# Altium project ublox_gnss_node.PrjPcb (part 3 of 3)

## Sheet Memory.SchDoc: Ublox GNSS Node
size A4; DocumentNumber: 10; SheetNumber: 10; SheetTotal: 12
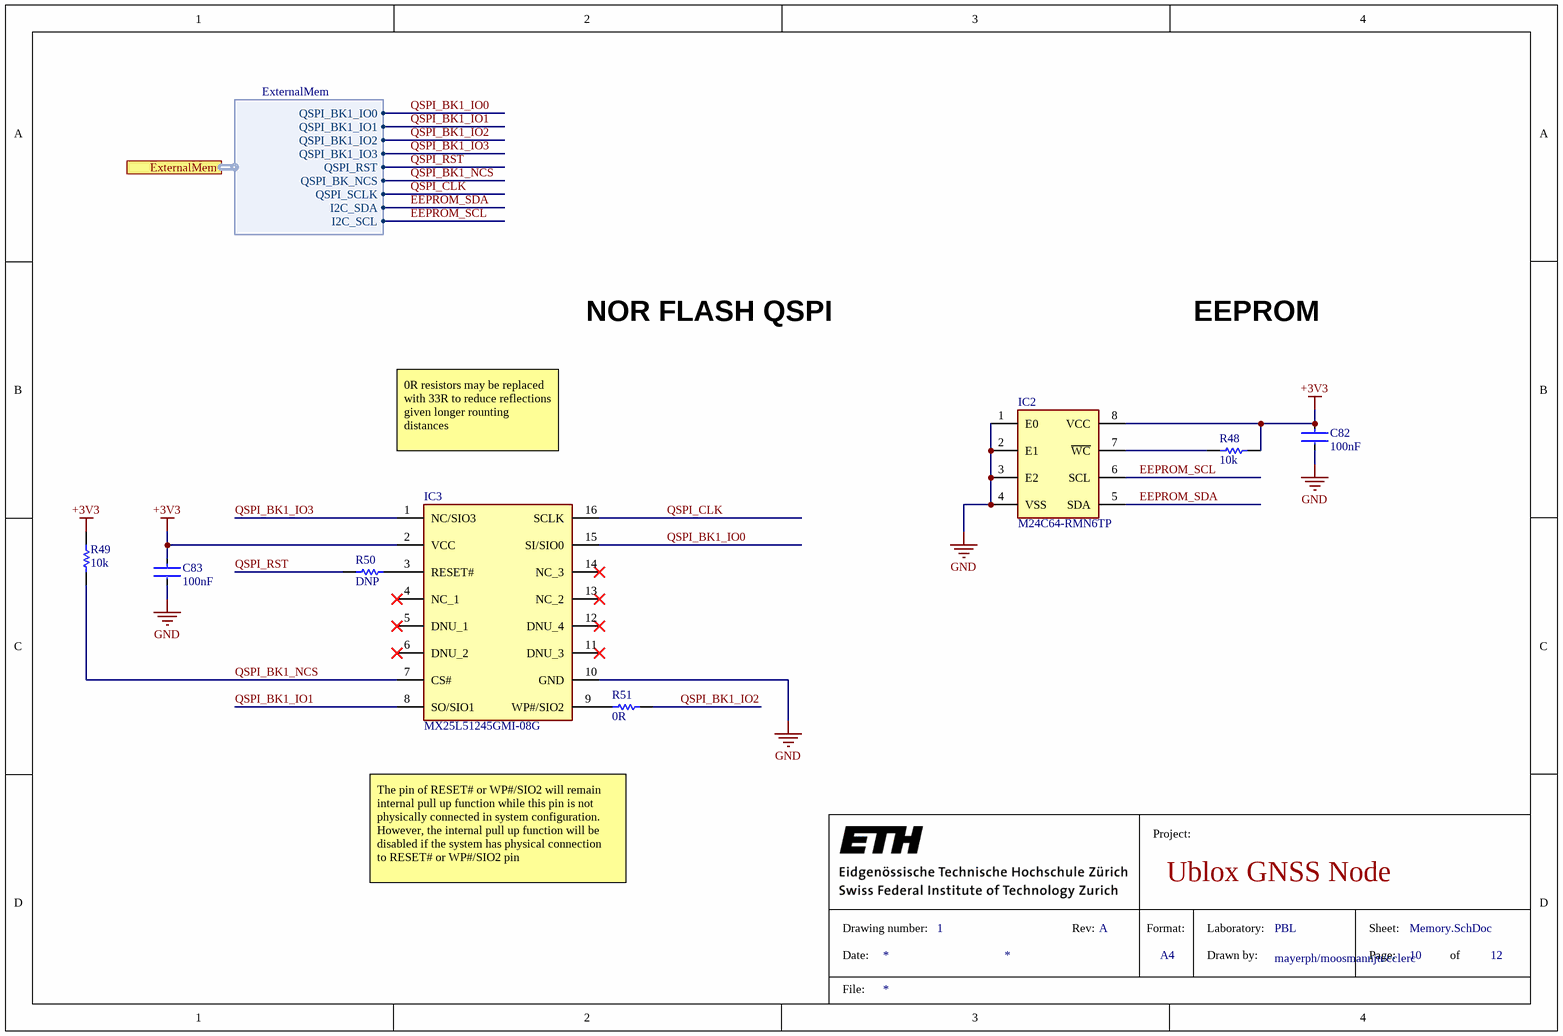
[diagram p9: Memory.SchDoc]

### Parts
C82  100nF  [FP-C0603C-CF-MFG]
C83  100nF  [FP-C0603C-CF-MFG]
IC2  M24C64-RMN6TP  [SOIC127P600X175-8N]
IC3  MX25L51245GMI-08G  [SOIC127P1030X265-16N]
R48  10k  [RESC1005X40X25ML05T05]
R49  10k  [RESC1005X40X25ML05T05]
R50  DNP  [RESC1005X40X25LL05T10]
R51  0R  [RESC1005X40X25LL05T10]

### Ports
ExternalMem (harness ExternalMem, see MAIN[6A], MCU[1C])

### Harnesses
ExternalMem: QSPI_BK1_IO0, QSPI_BK1_IO1, QSPI_BK1_IO2, QSPI_BK1_IO3, QSPI_RST, QSPI_BK_NCS, QSPI_SCLK, I2C_SDA, I2C_SCL

### Nets
+3V3: C82.1 C83.1 IC2.8(VCC) IC3.2(VCC) R48.2 R49.2
GND: C82.2 C83.2 IC2.1(E0) IC2.2(E1) IC2.3(E2) IC2.4(VSS) IC3.10(GND)
EEPROM_SCL: IC2.6(SCL) ; port ExternalMem.I2C_SCL
EEPROM_SDA: IC2.5(SDA) ; port ExternalMem.I2C_SDA
QSPI_BK1_IO0: IC3.15(SI/SIO0) ; port ExternalMem.QSPI_BK1_IO0
QSPI_BK1_IO1: IC3.8(SO/SIO1) ; port ExternalMem.QSPI_BK1_IO1
QSPI_BK1_IO2: R51.2 ; port ExternalMem.QSPI_BK1_IO2
QSPI_BK1_IO3: IC3.1(NC/SIO3) ; port ExternalMem.QSPI_BK1_IO3
QSPI_BK1_NCS: IC3.7(CS#) R49.1 ; port ExternalMem.QSPI_BK_NCS
QSPI_CLK: IC3.16(SCLK) ; port ExternalMem.QSPI_SCLK
QSPI_RST: R50.1 ; port ExternalMem.QSPI_RST
NetIC2_7: IC2.7(~{WC}) R48.1
NetIC3_3: IC3.3(RESET#) R50.2
NetIC3_9: IC3.9(WP#/SIO2) R51.1

Not connected (* = marked no-connect by the designer): IC3 4(NC_1)* 5(DNU_1)* 6(DNU_2)* 11(DNU_3)* 12(DNU_4)* 13(NC_2)* 14(NC_3)*

### Notes on the sheet
- NOR FLASH QSPI
- EEPROM
- 0R resistors may be replaced with 33R to reduce reflections given longer rounting distances
- The pin of RESET# or WP#/SIO2 will remain
  internal pull up function while this pin is not
  physically connected in system configuration.
  However, the internal pull up function will be
  disabled if the system has physical connection
  to RESET# or WP#/SIO2 pin
- Project:
- Drawing number:
- Date:
- 1
- Rev:
- Format:
- A4
- Laboratory:
- Drawn by:
- Sheet:
- Page:
- of
- File:

### Library data of the parts
C82 C83 = CMP-2006-03061-2: Capacitor 100nF 0603; Manufacturer: KEMET; Manufacturer Part Number: C0603C104K5RACTU; Tolerance: 0.1; Temperature Coefficient: 30ppm/°C; Material: Ceramic; Automotive Grade: Grade 1; Voltage Rating: 50 V; Value: 0.10 μF; Temperature Characteristic: X7R; Temperature: -55°C to +125°C; RoHS: TRUE; Temperature Range High: +125°C; Lead Free: Yes; Octopart: https://octopart.com/c0603c104k5ractu-kemet-139244; Digikey Description: CAP CER 0.1UF 50V X7R 0603; Category: Cap; Package: C0603C-CF; ComponentLink2Description: Datasheet; Temperature Range Low: -55°C; Device Class L1: Passive Components; Automotive: Yes; Device Class L3: Ceramic Capacitors; ComponentLink2URL: https://api.kemet.com/component-edge/download/datasheet/C0603C100J5GACAUTO.pdf; Capacitance: 0.10 μF; Device Class L2: Capacitors; Height: 0.87mm; Supplier 1: Mouser; Supplier Part Number 1: 80-C0603C104K5R7867
IC2 = M24C64-FMN6TP: EEPROM ST 64kbit I2C; Manufacturer_Name: STMicroelectronics; Datasheet Link: https://www.st.com/resource/en/datasheet/m24c64-f.pdf; Height: 1.75mm; Mouser Part Number: 511-M24C64-RMN6TP; Mouser Price/Stock: https://www.mouser.co.uk/ProductDetail/STMicroelectronics/M24C64-FMN6TP?qs=bKyP%252BnDORLFSmkTpM6wmYg%3D%3D; Arrow Part Number: M24C64-RMN6TP; Arrow Price/Stock: https://www.arrow.com/en/products/m24c64-fmn6tp/stmicroelectronics?utm_currency=USD&region=europe; Manufacturer Part Number: M24C64-RMN6TP
IC3 = MX25L51245GMI-08G: NOR Flahs 512MBit QSPI Macronix; Datasheet Link: https://datasheet.datasheetarchive.com/originals/dk/DKDS-14/274585.pdf; Height: 2.65mm; Manufacturer_Name: Macronix; Manufacturer Part Number: MX25L51245GMI-08G; Arrow Part Number: MX25L51245GMI-08G; Arrow Price/Stock: https://www.arrow.com/en/products/mx25l51245gmi-08g/macronix-international?region=nac
R48 R49 = CMP-2002-00433-1: Resistor 10k 0402; Manufacturer Part Number: ERJ-2GEJ103X; Manufacturer: Panasonic; Supplier 1: Mouser; Supplier Part Number 1: 667-ERJ-2GEJ103X
R50 R51 = CMP-2002-03041-1: Resistor 0R 0402; Part Number: CRCW04020000Z0EDHP; Manufacturer: Vishay Dale; Value: 0Ohm; Voltage Rating: 50V; Power Rating: 200mW; Temperature Coefficient: 0ppm/°C; Max Power Dissipation: 125mW; Supplier 1: Digi-Key; Supplier Part Number 1: 541-0.0YBCT-ND; Manufacturer Part Number: CRCW04020000Z0EDHP; RoHS: Yes; Category: Chip SMD Resistors; Stock 1: 527407; Pricing 1: 1=0.13000, 10=0.11300, 25=0.07840, 50=0.06080, 100=0.04350, 250=0.03388, 500=0.02694, 1000=0.01912, 5000=0.01477 (USD); Mount: Surface Mount; Case/Package: 0402; Weight: 2.3E-05oz; Case Code (Metric): 1005; Case Code (Imperial): 0402; Contact Plating: Tin; Min Operating Temperature: -55°C; Max Operating Temperature: 155°C; Packaging: Tape and Reel; Composition: Thick Film; Termination: SMD/SMT; Voltage Rating (DC): 50V; Package Quantity: 1; Military Standard: Not; Number of Terminations: 2; Features: Automotive AEC-Q200; Length: 1mm; Height: 0.3mm; Width: 0.02inch; Depth: 0.5mm; Radiation Hardening: No; REACH SVHC: Unknown; Lead Free: Lead Free; ComponentLink1URL: https://datasheet.ciiva.com/16494/crcwhpe3-16494453.pdf?src-supplier=Future+Electronics; ComponentLink1Description: https://datasheet.ciiva.com/16494/crcwhpe3-16494453.pdf?src-supplier=Future+Electronics; ComponentLink2URL: https://datasheet.ciiva.com/2470/crcwhpe3-2470555.pdf?src-supplier=Digi-Key; ComponentLink2Description: https://datasheet.ciiva.com/2470/crcwhpe3-2470555.pdf?src-supplier=Digi-Key; ComponentLink3URL: https://datasheet.ciiva.com/5562/crcwhpe3-46056-5562315.pdf?src-supplier=Mouser; ComponentLink3Description: https://datasheet.ciiva.com/5562/crcwhpe3-46056-5562315.pdf?src-supplier=Mouser; ComponentLink4URL: https://datasheet.ciiva.com/9109/crcwhpe3-9109963.pdf?src-supplier=Avnet; ComponentLink4Description: https://datasheet.ciiva.com/9109/crcwhpe3-9109963.pdf?src-supplier=Avnet; ComponentLink5URL: https://datasheet.ciiva.com/2470/crcwhpe3-2470556.pdf?src-supplier=Digi-Key; ComponentLink5Description: https://datasheet.ciiva.com/2470/crcwhpe3-2470556.pdf?src-supplier=Digi-Key; ComponentLink6URL: https://datasheet.ciiva.com/28621/1912814-28621324.pdf?src-supplier=Element14; ComponentLink6Description: https://datasheet.ciiva.com/28621/1912814-28621324.pdf?src-supplier=Element14; ComponentLink7URL: https://datasheet.ciiva.com/2470/crcwhpe3-2470557.pdf?src-supplier=Digi-Key; ComponentLink7Description: https://datasheet.ciiva.com/2470/crcwhpe3-2470557.pdf?src-supplier=Digi-Key; ComponentLink8URL: https://datasheet.ciiva.com/7725/crcwhpe3-7725758.pdf?src-supplier=Element14; ComponentLink8Description: https://datasheet.ciiva.com/7725/crcwhpe3-7725758.pdf?src-supplier=Element14

## Sheet Mikro_Bus.SchDoc: Ublox GNSS Node
size A4; DocumentNumber: 11; SheetNumber: 11; SheetTotal: 12
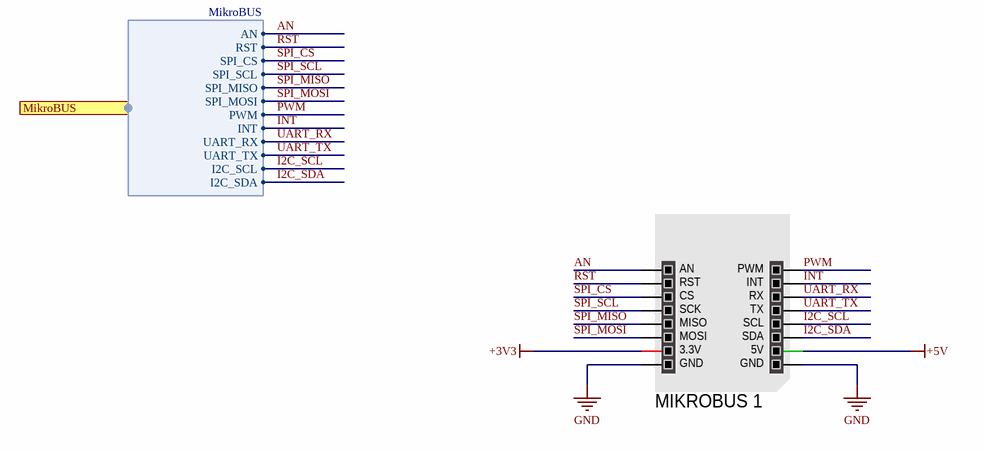
[diagram p10: Mikro_Bus.SchDoc]

### Parts
MIKROBUS_1  MIKROBUS HOST CONN.  [MIKROBUS HOST CONN. SMD]  (value not drawn)

### Ports
MikroBUS (harness MikroBUS, see MAIN[3A], MCU[1C])

### Harnesses
MikroBUS: AN, RST, SPI_CS, SPI_SCL, SPI_MISO, SPI_MOSI, PWM, INT, UART_RX, UART_TX, I2C_SCL, I2C_SDA

### Nets
+3V3: MIKROBUS_1.7(3.3V)
+5V: MIKROBUS_1.10(5V)
GND: MIKROBUS_1.8(GND) MIKROBUS_1.9(GND)
AN: MIKROBUS_1.1(AN) ; port MikroBUS.AN  [project net ADC]
I2C_SCL: MIKROBUS_1.12(SCL) ; port MikroBUS.I2C_SCL
I2C_SDA: MIKROBUS_1.11(SDA) ; port MikroBUS.I2C_SDA
INT: MIKROBUS_1.15(INT) ; port MikroBUS.INT
PWM: MIKROBUS_1.16(PWM) ; port MikroBUS.PWM  [project net MB_PWM]
RST: MIKROBUS_1.2(RST) ; port MikroBUS.RST  [project net MB_RST]
SPI_CS: MIKROBUS_1.3(CS) ; port MikroBUS.SPI_CS
SPI_MISO: MIKROBUS_1.5(MISO) ; port MikroBUS.SPI_MISO  [project net SPI3_MISO]
SPI_MOSI: MIKROBUS_1.6(MOSI) ; port MikroBUS.SPI_MOSI  [project net SPI3_MOSI]
SPI_SCL: MIKROBUS_1.4(SCK) ; port MikroBUS.SPI_SCL  [project net SPI3_SCLK]
UART_RX: MIKROBUS_1.14(RX) ; port MikroBUS.UART_RX  [project net UART5_RX]
UART_TX: MIKROBUS_1.13(TX) ; port MikroBUS.UART_TX  [project net UART5_TX]

### Notes on the sheet
- Project:
- Drawing number:
- Date:
- 1
- Rev:
- Format:
- A4
- Laboratory:
- Drawn by:
- Sheet:
- Page:
- of
- File:

### Library data of the parts
MIKROBUS_1 = MIKROBUS HOST CONN._1: mikroBUS Host Socket; SMD: No; Supplier: DigiKey; Supplier Part Number: 1471-MIKROE-5210-ND

## Sheet POE_PMUX.SchDoc: Ublox GNSS Node
size A4; DocumentNumber: 12; SheetNumber: 12; SheetTotal: 12
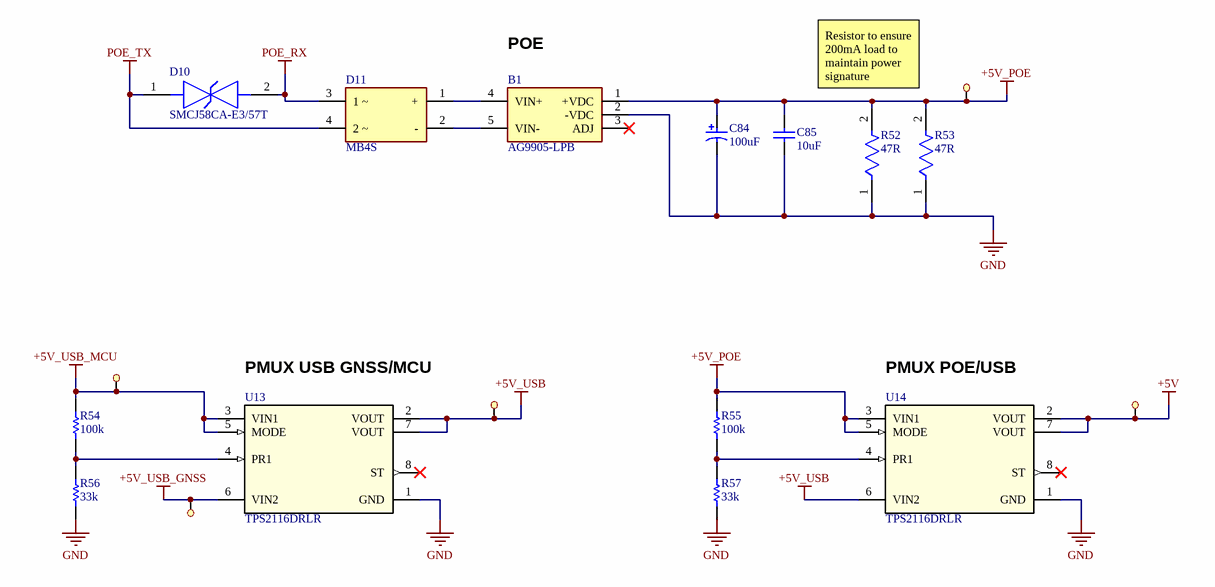
[diagram p11: POE_PMUX.SchDoc]

### Parts
*25  testpoint  [testpoint]  (value not drawn)
*26  testpoint  [testpoint]  (value not drawn)
*27  testpoint  [testpoint]  (value not drawn)
*28  testpoint  [testpoint]  (value not drawn)
*29  testpoint  [testpoint]  (value not drawn)
B1  AG9905-LPB  [AG9905MTB]
C84  100uF  [NIC-CAPA2-6.3X7.7_V]
C85  10uF  [FP-GRM188-0_2-IPC_C]
D10  SMCJ58CA-E3/57T  [FP-95402-MFG]
D11  MB4S  [FP-751EP-MFG]
R52  47R  [FP-RMCF2512-MFG]
R53  47R  [FP-RMCF2512-MFG]
R54  100k  [RESC0603(1608)_N]
R55  100k  [RESC0603(1608)_N]
R56  33k  [RESC3116X65X40LL10T20]
R57  33k  [RESC3116X65X40LL10T20]
U13  TPS2116DRLR  [DRL0008A-MFG]
U14  TPS2116DRLR  [DRL0008A-MFG]

### Nets
+5V: *28.1 U14.2(VOUT) U14.7(VOUT)
+5V_POE: *25.1 B1.1(+VDC) C84.1 C85.2 R52.2 R53.2 R55.1 U14.3(VIN1) U14.5(MODE)
+5V_USB: *27.1 U13.2(VOUT) U13.7(VOUT) U14.6(VIN2)
+5V_USB_GNSS: *29.1 U13.6(VIN2)
+5V_USB_MCU: *26.1 R54.1 U13.3(VIN1) U13.5(MODE)
GND: B1.2(-VDC) C84.2 C85.1 R52.1 R53.1 R56.2 R57.2 U13.1(GND) U14.1(GND)
POE_RX: D10.2 D11.3(1_~)
POE_TX: D10.1 D11.4(2_~)
NetB1_4: B1.4(VIN+) D11.1(+)
NetB1_5: B1.5(VIN-) D11.2(-)
NetR54_2: R54.2 R56.1 U13.4(PR1)
NetR55_2: R55.2 R57.1 U14.4(PR1)

Not connected (* = marked no-connect by the designer): B1 3(ADJ)*; U13 8(ST)*; U14 8(ST)*

### Notes on the sheet
- (near B1) POE
- Resistor to ensure 200mA load to maintain power signature
- (near U13) PMUX USB GNSS/MCU
- (near U14) PMUX POE/USB
- Project:
- Drawing number:
- Date:
- 1
- Rev:
- Format:
- A4
- Laboratory:
- Drawn by:
- Sheet:
- Page:
- of
- File:

### Library data of the parts
B1 = AG9905-MTB: Power over Ethernet - PoE PD Module, Isolated DC-DC converter, IEEE802.3af compliant, Over Temp. Protection, Ind Temp. Range, Small Footprint, SMT. (Blocks not pins).; Manufacturer Name: Silvertel; Geometry.Height: 13.05mm; Manufacturer Part Number: AG9905-LPB; Mouser Part Number: 480-AG9905-LPB; Mouser Price/Stock: https://www.mouser.co.uk/ProductDetail/Silvertel/AG9905-MTB?qs=vvQtp7zwQdPQM58WrfW9tQ%3D%3D; Arrow Part Number: *; Arrow Price/Stock: *; Datasheet Link: https://www.silvertel.com/images/datasheets/Ag9900M-datasheet-ultra-miniature-isolated-Power-over-Ethernet-POE-module.pdf
C84 = CMP-0687-00063-1: Aluminum Electrolytic Capacitor, UD Series, Low Impedance, 100 uF, 25 V, + / - 20%, -55 to 105 degC, Chip Type, 6.3 x 7.7 mm D x L, Pb-Free, Reel; PartNumber: UUD1E101MCL1GS; Manufacturer: Nichicon; Rated Ripple Current (at 100kHz): 280 mA; Endurance Time: 2000 h; Rated Voltage: 25 V; Packing: Dia382mm Reel; Tolerance Rated Capacitance: -20 to 20%; Impedance: 0.34 Ohm; PackageReference: CAPAE-D6.3H7.7; RoHS: TRUE; PackageDescription: 2-Pin Surface Mount Device, Diameter 6.3 mm, Height 7.7 mm, Pitch 5.4 mm; Mounting Technology: Surface Mount; ComponentLink3Description: Package Specification; Diameter: 6.3 mm; DatasheetVersion: 08/2012; ComponentLink3URL: http://products.nichicon.co.jp/en/pdf/XJA043/e-ud.pdf; Length: 7.7 mm; ComponentLink2Description: Datasheet; ComponentLink2URL: http://products.nichicon.co.jp/en/pdf/XJA043/e-ud.pdf; Rated Capacitance: 100 uF; ComponentLink1Description: Manufacturer URL; ComponentLink1URL: http://www.nichicon.co.jp/
C85 = GRM188R61E106MA73D: CAP CER 10UF 25V X5R 0603; Manufacturer: Murata; Tolerance: 20%; Supplier: Digi-Key; Supplier Part Number: 490-7202-6-ND; Manufacturer Part Number: GRM188R61E106MA73D; RoHS: Yes; Category: Ceramic Capacitors; Stock: 3353344; Pricing: 1=0.26, 10=0.176, 50=0.1176, 100=0.0999, 500=0.07054, 1000=0.06173 (USD); ComponentLink1URL: https://datasheet.ciiva.com/14906/partnumbering-e-01-14906429.pdf?src-supplier=Digi-Key; ComponentLink1Description: https://datasheet.ciiva.com/14906/partnumbering-e-01-14906429.pdf?src-supplier=Digi-Key; ComponentLink2URL: https://datasheet.ciiva.com/14906/partnumbering-e-01-14906431.pdf?src-supplier=Digi-Key; ComponentLink2Description: https://datasheet.ciiva.com/14906/partnumbering-e-01-14906431.pdf?src-supplier=Digi-Key; ComponentLink3URL: https://datasheet.ciiva.com/22776/608985-22776426.pdf?src-supplier=Farnell; ComponentLink3Description: https://datasheet.ciiva.com/22776/608985-22776426.pdf?src-supplier=Farnell; ComponentLink4URL: https://datasheet.ciiva.com/22776/c02e-22776427.pdf?src-supplier=Farnell; ComponentLink4Description: https://datasheet.ciiva.com/22776/c02e-22776427.pdf?src-supplier=Farnell; ComponentLink5URL: https://datasheet.ciiva.com/22619/c02e-22619674.pdf?src-supplier=Element14; ComponentLink5Description: https://datasheet.ciiva.com/22619/c02e-22619674.pdf?src-supplier=Element14; Value: 10uF
D10 = CMP-02577-000016-1: TVS DIODE 58V 93.6V DO214AB; Manufacturer: Vishay Semiconductor Diodes Division; Standoff Height: 0mm; Peak Pulse Power: 1500W; Direction: Bidirectional; Automotive Grade: NA; Peak Pulse Current: 16A; Max Junction Temp: +150°C; Breakdown Voltage: 64.4V; Number Of Channels: 1; Temperature Range Low: -55°C; Mouser Description: TVS Diodes - Transient Voltage Suppressors 1500W 58V Bidirect; ComponentLink2URL: https://www.vishay.com/docs/88394/smcj.pdf; Height: 2.62mm; Octopart: https://octopart.com/smcj58ca-e3%2F57t-vishay-39599086; Temperature: -55°C to +150°C; Clamping Voltage: 93.6V; Device Class L1: Circuit Protection; Category: Diode; Automotive: No; Manufacturer Part Number: SMCJ58CA-E3/57T; ComponentLink2Description: Datasheet; Lead Free: Yes; Package: 95402; Temperature Range High: +150°C; Device Class L2: TVS Diodes; Device Class L3: unset; RoHS: TRUE; Footprint Url: http://www.vishay.com/docs/95402/smc.pdf; Digikey Description: TVS DIODE 58V 93.6V DO214AB; Reverse Standoff Voltage: 58V
D11 = CMP-07163-000033-1: BRIDGE RECT 1P 400V 500MA 4SOIC; Manufacturer: ON Semiconductor; Value: 13pF; Forward Current: 0.5A; Standoff Height: 0.05mm; Max Junction Temp: +150°C; Peak Reverse Current: 5uA; Max Surge Forward Current: 35A; Category: Diode; ComponentLink2Description: Datasheet; Max Repetitive Reverse Voltage: 400V; Device Class L1: Discrete Semiconductors; Mouser Description: Bridge Rectifiers 0.5A Bridge; Capacitance: 13pF; Lead Free: Yes; Device Class L2: Diodes; Height: 2.9mm; Temperature: -55°C to +150°C; Reverse Voltage: 400V; Manufacturer Part Number: MB4S; RoHS: TRUE; Temperature Range High: +150°C; Automotive: No; Package: 751EP; Octopart: https://octopart.com/mb4s-on+semiconductor-84329762; Temperature Range Low: -55°C; Ipc Land Pattern Name: SOIC254P670X265-4; Digikey Description: BRIDGE RECT 1P 400V 500MA 4SOIC; ComponentLink2URL: https://www.onsemi.com/pub/Collateral/MB8S-D.PDF; Device Class L3: Rectifier Diodes
R52 R53 = CMP-26527-006410-1: 47Ω ±5% 1W 2512 Thick Film Chip Resistor AEC-Q200 compliant; Manufacturer: Stackpole Electronics; Manufacturer Part Number: RMCF2512JT47R0; Temperature Coefficient: 200ppm/°C; Voltage Rating: 200V; Case Code (Metric): 6432; Tolerance: 5%; Power Rating: 1W; Number of Terminations: 2; Packaging: Tape and Reel; Min Operating Temperature: -55°C; Case Code (Imperial): 2512; Depth: 3.2mm; RoHS Compliant: Yes; Case/Package: 2512; Max Power Dissipation: 1W; Resistor Type: Thick Film; Military Standard: Not; Series: RMCF; Mount: Surface Mount; Features: Automotive AEC-Q200; Resistance: 47R; Contact Plating: Tin; Width: 0.126inch; Height: 0.028inch; Lead Free: Lead Free; Max Operating Temperature: 155°C; Length: 0.248inch; Construction: Rectangular; Radiation Hardening: No; Supplier: Avnet; Supplier Part Number: RMCF2512JT47R0; RoHS: Compliant; Category: Chip SMD Resistors; Stock: 96000; Pricing: 4000=0.03536, 8000=0.03484, 16000=0.03432, 32000=0.0338, 64000=0.03328 (USD); China RoHS: Non-Compliant; Composition: Thick Film; Country of Origin: Japan, Mainland China, Taiwan; Export Control Classification Number (ECCN) Code: EAR99; Harmonized Tariff Schedule (HTS) Code: 8533.21.00.30; Introduction Date: 2011-01-07; Lifecycle Status: Production; Mounting Technology: Surface Mount; Number of Terminals: 2; Ratings: AEC-Q200; REACH SVHC: Yes; Value: 47Ω; Schedule B: 8533210045, 8533210045|8533210045, 8533210045|8533210045|8533210045, 8533210045|8533210045|8533210045|8533210045; Working Voltage: 200V; ComponentLink1URL: https://datasheet.octopart.com:443/RMCF2512JT47R0-Stackpole-Electronics-datasheet-182148065.pdf?src-supplier=IHS; ComponentLink1Description: https://datasheet.octopart.com:443/RMCF2512JT47R0-Stackpole-Electronics-datasheet-182148065.pdf?src-supplier=IHS; ComponentLink2URL: https://datasheet.octopart.com:443/RMCF2512JT47R0-Stackpole-Electronics-datasheet-28504820.pdf?src-supplier=Upverter; ComponentLink2Description: https://datasheet.octopart.com:443/RMCF2512JT47R0-Stackpole-Electronics-datasheet-28504820.pdf?src-supplier=Upverter; ComponentLink3URL: https://datasheet.octopart.com:443/RMCF2512JT47R0-Stackpole-Electronics-datasheet-141193804.pdf?src-supplier=Master+Electronics; ComponentLink3Description: https://datasheet.octopart.com:443/RMCF2512JT47R0-Stackpole-Electronics-datasheet-141193804.pdf?src-supplier=Master+Electronics; ComponentLink4URL: https://datasheet.octopart.com:443/RMCF2512JT47R0-Stackpole-Electronics-datasheet-189104163.pdf?src-supplier=Master+Electronics; ComponentLink4Description: https://datasheet.octopart.com:443/RMCF2512JT47R0-Stackpole-Electronics-datasheet-189104163.pdf?src-supplier=Master+Electronics; ComponentLink5URL: https://datasheet.octopart.com:443/RMCF2512JT47R0-Stackpole-Electronics-datasheet-116606903.pdf?src-supplier=Master+Electronics; ComponentLink5Description: https://datasheet.octopart.com:443/RMCF2512JT47R0-Stackpole-Electronics-datasheet-116606903.pdf?src-supplier=Master+Electronics; ComponentLink6URL: https://datasheet.octopart.com:443/RMCF2512JT47R0-Stackpole-Electronics-datasheet-62091608.pdf?src-supplier=Stackpole+Electronics; ComponentLink6Description: https://datasheet.octopart.com:443/RMCF2512JT47R0-Stackpole-Electronics-datasheet-62091608.pdf?src-supplier=Stackpole+Electronics; ComponentLink7URL: https://datasheet.octopart.com:443/RMCF2512JT47R0-Stackpole-Electronics-datasheet-12534581.pdf?src-supplier=Stackpole+Electronics; ComponentLink7Description: https://datasheet.octopart.com:443/RMCF2512JT47R0-Stackpole-Electronics-datasheet-12534581.pdf?src-supplier=Stackpole+Electronics; ComponentLink8URL: https://datasheet.octopart.com:443/RMCF2512JT47R0-Stackpole-Electronics-datasheet-10788263.pdf?src-supplier=Stackpole+Electronics; ComponentLink8Description: https://datasheet.octopart.com:443/RMCF2512JT47R0-Stackpole-Electronics-datasheet-10788263.pdf?src-supplier=Stackpole+Electronics; ComponentLink9URL: https://datasheet.octopart.com:443/RMCF2512JT47R0-Stackpole-Electronics-datasheet-11547379.pdf?src-supplier=Future+Electronics; ComponentLink9Description: https://datasheet.octopart.com:443/RMCF2512JT47R0-Stackpole-Electronics-datasheet-11547379.pdf?src-supplier=Future+Electronics; ComponentLink10URL: https://datasheet.octopart.com:443/RMCF2512JT47R0-Stackpole-Electronics-datasheet-8359789.pdf?src-supplier=Future+Electronics; ComponentLink10Description: https://datasheet.octopart.com:443/RMCF2512JT47R0-Stackpole-Electronics-datasheet-8359789.pdf?src-supplier=Future+Electronics; ComponentLink11URL: https://datasheet.octopart.com:443/RMCF2512JT47R0-Stackpole-Electronics-datasheet-8324226.pdf?src-supplier=Future+Electronics; ComponentLink11Description: https://datasheet.octopart.com:443/RMCF2512JT47R0-Stackpole-Electronics-datasheet-8324226.pdf?src-supplier=Future+Electronics; ComponentLink12URL: https://datasheet.octopart.com:443/RMCF2512JT47R0-Stackpole-Electronics-datasheet-8088878.pdf?src-supplier=Future+Electronics; ComponentLink12Description: https://datasheet.octopart.com:443/RMCF2512JT47R0-Stackpole-Electronics-datasheet-8088878.pdf?src-supplier=Future+Electronics; ComponentLink13URL: https://datasheet.octopart.com:443/RMCF2512JT47R0-Stackpole-Electronics-datasheet-5313682.pdf?src-supplier=Future+Electronics; ComponentLink13Description: https://datasheet.octopart.com:443/RMCF2512JT47R0-Stackpole-Electronics-datasheet-5313682.pdf?src-supplier=Future+Electronics; ComponentLink14URL: http://sigma.octopart.com:80/15940719/materials_sheet/Stackpole-Electronics-RMCF2512JT47R0.pdf?src-supplier=Compliance+Statements; ComponentLink14Description: http://sigma.octopart.com:80/15940719/materials_sheet/Stackpole-Electronics-RMCF2512JT47R0.pdf?src-supplier=Compliance+Statements; ComponentLink15URL: http://sigma.octopart.com:80/141158211/reach_statement/Stackpole-Electronics-RMCF2512JT47R0.pdf?src-supplier=Compliance+Statements; ComponentLink15Description: http://sigma.octopart.com:80/141158211/reach_statement/Stackpole-Electronics-RMCF2512JT47R0.pdf?src-supplier=Compliance+Statements; ComponentLink16URL: http://sigma.octopart.com:80/141158212/rohs_statement/Stackpole-Electronics-RMCF2512JT47R0.pdf?src-supplier=Compliance+Statements; ComponentLink16Description: http://sigma.octopart.com:80/141158212/rohs_statement/Stackpole-Electronics-RMCF2512JT47R0.pdf?src-supplier=Compliance+Statements
R54 = CMP-1012-00736-1: 100K 0.1W 1% 0603 (1608 Metric)  SMD; Manufacturer: Vishay; Manufacturer Part Number: CRCW0603100KFKTC; Value: 100000.00 Ohm; Case-Metric: 1608; Case-EIA: 0603; Max Power Dissipation: 100mW; Temperature Coefficient: 100ppm/°C; Working Voltage: 75V; Power: 0.1 W; Tolerance: 1 %; Technology: SMT; Supplier: DigiKey; Supplier Part Number: CRCW0603100KFKTC-ND; Category: Chip SMD Resistors; Pricing: 20000=0.01889 (USD); Case/Package: 0603; Composition: Thick Film; Contact Plating: Lead, Tin; Features: Automotive AEC-Q200; Height: 450µm; Lead Free: Contains Lead; Length: 1.55mm; Lifecycle Status: Production; Max Operating Temperature: 155°C; Min Operating Temperature: -55°C; Mounting Technology: Surface Mount; Number of Terminals: 2; Number of Terminations: 2; Packaging: Tape & Reel; Power Rating: 100mW; Radiation Hardening: No; Ratings: AEC-Q200; REACH SVHC: No; RoHS: Non-Compliant; Width: 850µm; ComponentLink1URL: https://datasheet.octopart.com:443/CRCW0603100KFKTC-Vishay-datasheet-175863636.pdf?src-supplier=IHS; ComponentLink1Description: https://datasheet.octopart.com:443/CRCW0603100KFKTC-Vishay-datasheet-175863636.pdf?src-supplier=IHS; ComponentLink2URL: https://datasheet.octopart.com:443/CRCW0603100KFKTC-Vishay-datasheet-182027442.pdf?src-supplier=IHS; ComponentLink2Description: https://datasheet.octopart.com:443/CRCW0603100KFKTC-Vishay-datasheet-182027442.pdf?src-supplier=IHS; ComponentLink3URL: https://datasheet.octopart.com/D-CRCW-Lead-%28Pb%29-Bearing-Thick-Film%2C-Rectangular-Chip-Resistors-Vishay-datasheet-family-72.pdf; ComponentLink3Description: https://datasheet.octopart.com/D-CRCW-Lead-%28Pb%29-Bearing-Thick-Film%2C-Rectangular-Chip-Resistors-Vishay-datasheet-family-72.pdf; ComponentLink4URL: https://datasheet.octopart.com/CRCW0603100KFKTC-Vishay-datasheet-13242068.pdf; ComponentLink4Description: https://datasheet.octopart.com/CRCW0603100KFKTC-Vishay-datasheet-13242068.pdf; ComponentLink5URL: https://datasheet.octopart.com/CRCW0603100KFKTC-Vishay-datasheet-13195083.pdf; ComponentLink5Description: https://datasheet.octopart.com/CRCW0603100KFKTC-Vishay-datasheet-13195083.pdf; ComponentLink6URL: https://datasheet.octopart.com/CRCW0603100KFKTC-Vishay-datasheet-13034211.pdf; ComponentLink6Description: https://datasheet.octopart.com/CRCW0603100KFKTC-Vishay-datasheet-13034211.pdf; ComponentLink7URL: https://datasheet.octopart.com/CRCW0603100KFKTC-Vishay-datasheet-12600034.pdf; ComponentLink7Description: https://datasheet.octopart.com/CRCW0603100KFKTC-Vishay-datasheet-12600034.pdf; ComponentLink8URL: https://datasheet.octopart.com/CRCW0603100KFKTC-Vishay-datasheet-12532161.pdf; ComponentLink8Description: https://datasheet.octopart.com/CRCW0603100KFKTC-Vishay-datasheet-12532161.pdf; ComponentLink9URL: https://datasheet.octopart.com/CRCW0603100KFKTC-Vishay-datasheet-12517896.pdf; ComponentLink9Description: https://datasheet.octopart.com/CRCW0603100KFKTC-Vishay-datasheet-12517896.pdf; ComponentLink10URL: https://datasheet.octopart.com/CRCW0603100KFKTC-Vishay-datasheet-12509762.pdf; ComponentLink10Description: https://datasheet.octopart.com/CRCW0603100KFKTC-Vishay-datasheet-12509762.pdf; ComponentLink11URL: https://datasheet.octopart.com/CRCW0603100KFKTC-Vishay-datasheet-10322335.pdf; ComponentLink11Description: https://datasheet.octopart.com/CRCW0603100KFKTC-Vishay-datasheet-10322335.pdf; ComponentLink12URL: https://datasheet.octopart.com/CRCW0603100KFKTC-Vishay-datasheet-8788789.pdf; ComponentLink12Description: https://datasheet.octopart.com/CRCW0603100KFKTC-Vishay-datasheet-8788789.pdf; ComponentLink13URL: https://datasheet.octopart.com/CRCW0603100KFKTC-Vishay-datasheet-8361388.pdf; ComponentLink13Description: https://datasheet.octopart.com/CRCW0603100KFKTC-Vishay-datasheet-8361388.pdf; ComponentLink14URL: https://datasheet.octopart.com/CRCW0603100KFKTC-Vishay-datasheet-5306405.pdf; ComponentLink14Description: https://datasheet.octopart.com/CRCW0603100KFKTC-Vishay-datasheet-5306405.pdf; ComponentLink15URL: https://datasheet.octopart.com/CRCW0603100KFKTC-Vishay-datasheet-546287.pdf; ComponentLink15Description: https://datasheet.octopart.com/CRCW0603100KFKTC-Vishay-datasheet-546287.pdf; ComponentLink16URL: http://sigma.octopart.com:80/rohs_statement/Vishay-company-15.pdf?src-supplier=Compliance+Statements; ComponentLink16Description: http://sigma.octopart.com:80/rohs_statement/Vishay-company-15.pdf?src-supplier=Compliance+Statements
R55 = CMP-1012-00736-1: 100K 0.1W 1% 0603 (1608 Metric)  SMD; Value: 100000.00 Ohm; Case-Metric: 1608; Case-EIA: 0603; Power: 0.1 W; Tolerance: 1 %; Technology: SMT
R56 R57 = CMP-2003-03510-1: Part Number: RC1206JR-1033KL; Manufacturer: Yageo
U13 U14 = TPS2116DRLR: 1.6-V to 5.5-V, 40-mâ„¦, 2.5-A, low-IQ, priority power multiplexer 8-SOT-5X3 -40 to 125; Manufacturer Name: Texas Instruments; TYPE: TYPE; RefDes: RefDes; Copyright: Copyright (C) 2026 Ultra Librarian. All rights reserved.; Manufacturer Part Number: TPS2116DRLR

## Nets that join several sheets
+3V3: MCU (43 pins), GNSS_ZED-X20P (6 pins), IndicatorLEDs (13 pins), USB_C_GNSS (C79.1 C80.1 U11.14 U11.16), USB_C_MCU (C71.1 C72.1 U8.14 U8.16), ETH (FB1.2 FB2.2 R31.1 R35.2), SENS_MEMS (8 pins), DCDC_Converters (8 pins), Memory (6 pins), Mikro_Bus (MIKROBUS_1.7)
+5V: DCDC_Converters (7 pins), Mikro_Bus (MIKROBUS_1.10), POE_PMUX (*28.1 U14.2 U14.7)
+5V_USB_GNSS: USB_C_GNSS (C75.2 U10.7), POE_PMUX (*29.1 U13.6)
+5V_USB_MCU: USB_C_MCU (C67.2 R40.1 U7.7), POE_PMUX (*26.1 R54.1 U13.3 U13.5)
GND: MCU (43 pins), GNSS_ZED-X20P (18 pins), USB_C_GNSS (7 pins), USB_C_MCU (8 pins), ETH (26 pins), SENS_MEMS (11 pins), DCDC_Converters (19 pins), Memory (7 pins), Mikro_Bus (MIKROBUS_1.8 MIKROBUS_1.9), POE_PMUX (9 pins)
POE_RX: ETH (C51.1 T1.10), POE_PMUX (D10.2 D11.3)
POE_TX: ETH (C52.1 T1.15), POE_PMUX (D10.1 D11.4)
ADC: MCU (IC1.37), Mikro_Bus (MIKROBUS_1.1)
EEPROM_SCL: MCU (IC1.97 R20.1), Memory (IC2.6)
EEPROM_SDA: MCU (IC1.96 R19.1), Memory (IC2.5)
ETH_CRS_DV: MCU (IC1.46), ETH (U4.18)
ETH_LED0: IndicatorLEDs (D1.1 R58.1), ETH (U4.30)
ETH_LED1: IndicatorLEDs (D3.1 R59.1), ETH (U4.31)
ETH_LED2: IndicatorLEDs (D5.1 R60.1), ETH (U4.28)
ETH_LED3: IndicatorLEDs (D6.1 R61.1), ETH (U4.29)
ETH_MDC: MCU (IC1.29), ETH (R35.1 U4.12)
ETH_MDIO: MCU (IC1.39), ETH (U4.11)
ETH_REF_CLK: MCU (IC1.38), ETH (U4.19)
ETH_RST: MCU (IC1.138), ETH (C53.2 U4.32)
ETH_RXD0: MCU (IC1.47), ETH (U4.16)
ETH_RXD1: MCU (IC1.48), ETH (U4.15)
ETH_TX_EN: MCU (IC1.124), ETH (U4.23)
ETH_TXD0: MCU (IC1.126), ETH (U4.24)
ETH_TXD1: MCU (IC1.73), ETH (U4.25)
GEOFENCE_STAT: MCU (IC1.5), GNSS_ZED-X20P (U3.19), IndicatorLEDs (D4.1)
GNSS_EXTINT: MCU (IC1.9), GNSS_ZED-X20P (U3.51)
GNSS_RESET_N: MCU (IC1.121), GNSS_ZED-X20P (R2.1)
GNSS_RTK_STAT: MCU (IC1.1), GNSS_ZED-X20P (U3.20), IndicatorLEDs (D2.1)
GNSS_TIMEPULSE: MCU (IC1.40), GNSS_ZED-X20P (U3.53)
GNSS_UART1_RX: MCU (IC1.76), GNSS_ZED-X20P (*10.1 U3.43)
GNSS_UART1_TX: MCU (IC1.77), GNSS_ZED-X20P (*11.1 U3.42)
I2C_SCL: MCU (IC1.53 R23.1), Mikro_Bus (MIKROBUS_1.12)
I2C_SDA: MCU (IC1.54 R21.1), Mikro_Bus (MIKROBUS_1.11)
INT: MCU (IC1.95), Mikro_Bus (MIKROBUS_1.15)
MB_PWM: MCU (IC1.84), Mikro_Bus (MIKROBUS_1.16)
MB_RST: MCU (IC1.49), Mikro_Bus (MIKROBUS_1.2)
MCU_LED_Green: MCU (IC1.122), IndicatorLEDs (D8.1)
MCU_LED_Red: MCU (IC1.74), IndicatorLEDs (D7.1)
MCU_LED_Yellow: MCU (IC1.139), IndicatorLEDs (D9.1)
QSPI_BK1_IO0: MCU (IC1.22), Memory (IC3.15)
QSPI_BK1_IO1: MCU (IC1.23), Memory (IC3.8)
QSPI_BK1_IO2: MCU (IC1.21), Memory (R51.2)
QSPI_BK1_IO3: MCU (IC1.20), Memory (IC3.1)
QSPI_BK1_NCS: MCU (IC1.86), Memory (IC3.7 R49.1)
QSPI_CLK: MCU (IC1.24), Memory (IC3.16)
QSPI_RST: MCU (IC1.85), Memory (R50.1)
SENS_ISM_INT: MCU (IC1.2), SENS_MEMS (U1.4)
SENS_LSM_INT: MCU (IC1.3), SENS_MEMS (U2.12)
SENS_LSM_INTM: MCU (IC1.4), SENS_MEMS (U2.7)
SPI3_MISO: MCU (IC1.110), Mikro_Bus (MIKROBUS_1.5)
SPI3_MOSI: MCU (IC1.51), Mikro_Bus (MIKROBUS_1.6)
SPI3_SCLK: MCU (IC1.109), Mikro_Bus (MIKROBUS_1.4)
SPI_CS: MCU (IC1.72 R24.1), Mikro_Bus (MIKROBUS_1.3)
SPI_CS_ISM: MCU (IC1.88 R25.1), SENS_MEMS (7.1 U1.12)
SPI_CS_MAG: MCU (IC1.87 R26.1), SENS_MEMS (5.1 U2.3)
SPI_CS_XL: MCU (IC1.83 R28.1), SENS_MEMS (6.1 U2.2)
SPI_MISO: MCU (IC1.30), SENS_MEMS (2.1 R1.2 U1.1 U2.4)
SPI_MOSI: MCU (IC1.75), SENS_MEMS (3.1 R1.1 U1.14)
SPI_SCK: MCU (IC1.66), SENS_MEMS (4.1 U1.13 U2.1)
UART5_RX: MCU (IC1.114), Mikro_Bus (MIKROBUS_1.14)
UART5_TX: MCU (IC1.111), Mikro_Bus (MIKROBUS_1.13)
USB_D_N: GNSS_ZED-X20P (U3.39), USB_C_GNSS (U11.11)
USB_D_P: GNSS_ZED-X20P (U3.40), USB_C_GNSS (U11.10)
USB_MCU_D_N: MCU (IC1.100), USB_C_MCU (U8.11)
USB_MCU_D_P: MCU (IC1.101), USB_C_MCU (U8.10)
VBUS_DETECT_MCU: MCU (IC1.98), USB_C_MCU (*20.1 R40.2 R41.2)

## Assembly variants
main: all parts fitted